# Altium schematic sheet Sheet_1_2026-11-01.schdoc
size 133 x 119 mm
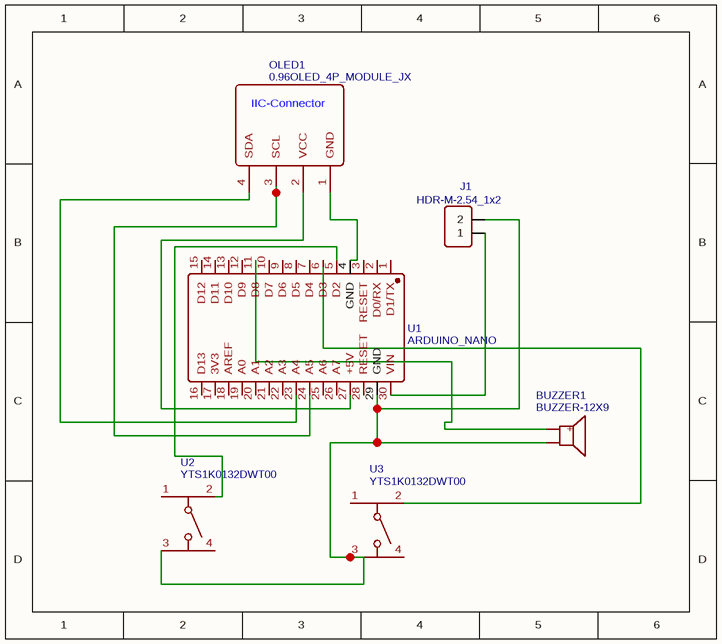
[diagram p0: Sheet_1_2026-11-01.schdoc]

## Parts
BUZZER1  BUZZER-12X9  [BUZ-TH_BD12.0-P7.60-D0.6-FD]
J1  HDR-M-2.54_1x2  [HDR-M-2.54_1X2]
OLED1  0.96OLED_4P_MODULE_JX  [0.96OLED_4P]
U1  ARDUINO_NANO  [COMM-TH_ARDUINO_NANO]
U2  YTS1K0132DWT00  [KEY-TH_4P-L6.0-W6.0-P4.50-LS6.5]
U3  YTS1K0132DWT00  [KEY-TH_4P-L6.0-W6.0-P4.50-LS6.5]

## Nets
NetBUZZER1_1: BUZZER1.1(+) U1.11(D8)
NetBUZZER1_2: BUZZER1.2 J1.2 U1.29(GND) U2.3 U3.3
NetJ1_1: J1.1 U1.30(VIN)
NetOLED1_1: OLED1.1(GND) U1.4(GND)
NetOLED1_2: OLED1.2(VCC) U1.27(+5V)
NetOLED1_3: OLED1.3(SCL) U1.24(A5)
NetOLED1_4: OLED1.4(SDA) U1.23(A4)
NetU1_5: U1.5(D2) U2.2

Not connected (* = marked no-connect by the designer): U1 1(D1/TX) 2(D0/RX) 3(RESET) 6(D3) 7(D4) 8(D5) 9(D6) 10(D7) 12(D9) 13(D10) 14(D11) 15(D12) 16(D13) 17(3V3) 18(AREF) 19(A0) 20(A1) 21(A2) 22(A3) 25(A6) 26(A7) 28(RESET); U2 1 4; U3 1 2 4

## Notes on the sheet
- (in symbol 0.96OLED_4P_MODULE_JX) IIC-Connector

## Library data of the parts
BUZZER1 = BUZZER-12X9: Manufacturer: null; Contributor: lcsc; Supplier: LCSC; Supplier Part: C9900016920; Manufacturer Part: buzzer-12X9; JLCPCB Part Class: Extended Part; spicePre: B; spiceSymbolName: BUZZER-12X9
J1 = HDR-M-2.54_1x2: Contributor: LCEDA_Lib; Supplier Part: C124375; Supplier: LCSC; spicePre: J; spiceSymbolName: HDR-M-2.54_1x2
OLED1 = 0.96OLED_4P_MODULE_JX: Manufacturer: null; Contributor: LCSC; Supplier: LCSC; Supplier Part: C9900004566; Manufacturer Part: 0.96OLED_4P_MODULE_JX; JLCPCB Part Class: Extended Part; spicePre: O; spiceSymbolName: 0.96OLED_4P_MODULE_JX
U1 = ARDUINO_NANO: Manufacturer: null; Contributor: lcsc; Supplier: LCSC; Supplier Part: C9900017879; Manufacturer Part: ARDUINO_NANO; JLCPCB Part Class: Extended Part; spicePre: U; spiceSymbolName: ARDUINO_NANO
U2 U3 = YTS1K0132DWT00: Manufacturer: YIYUAN(怡远); Contributor: lcsc; Supplier: LCSC; Supplier Part: C5121243; Manufacturer Part: YTS1K0132DWT00; JLCPCB Part Class: Extended Part; spicePre: U; spiceSymbolName: YTS1K0132DWT00